# Altium schematic sheet Lab_8.SchDoc
size A; SheetNumber: 4; SheetTotal: 4
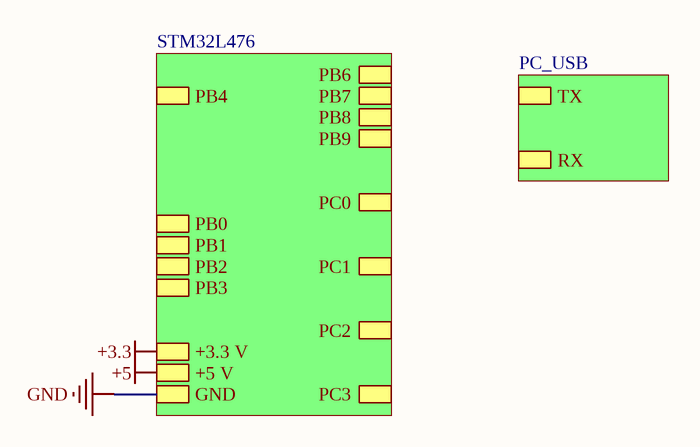
[diagram p0: Lab_8.SchDoc]

## Sub-sheets
PC_USB = File Name: TX, RX
STM32L476 = File Name: PB0, PB1, PB2, PB3, PB4, PB6, PB7, PB8, PB9, PC0, PC1, PC2, PC3, +3.3 V, +5 V, GND

## Nets
+3.3: sheet STM32L476/+3.3 V
+5: sheet STM32L476/+5 V
GND: sheet STM32L476/GND